# Altium schematic sheet TOP.SchDoc
size A2; SheetNumber: 1; SheetTotal: 4
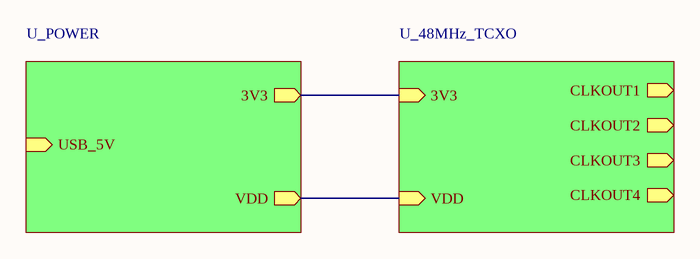
[diagram p0: TOP.SchDoc]

## Sub-sheets
U_48MHz_TCXO = 48MHz_TCXO.SchDoc: 3V3 (in), VDD (in), CLKOUT1 (out), CLKOUT2 (out), CLKOUT3 (out), CLKOUT4 (out)
U_POWER = POWER.SchDoc: 3V3 (out), VDD (out), USB_5V (in)

## Nets
(unnamed): sheet U_POWER/3V3, sheet U_48MHz_TCXO/3V3
(unnamed): sheet U_POWER/VDD, sheet U_48MHz_TCXO/VDD